# Altium schematic sheet USB_interface.SchDoc: =DT_SCH_Title
size A4; Organization: Droid Technologies; SheetNumber: 19; SheetTotal: 21
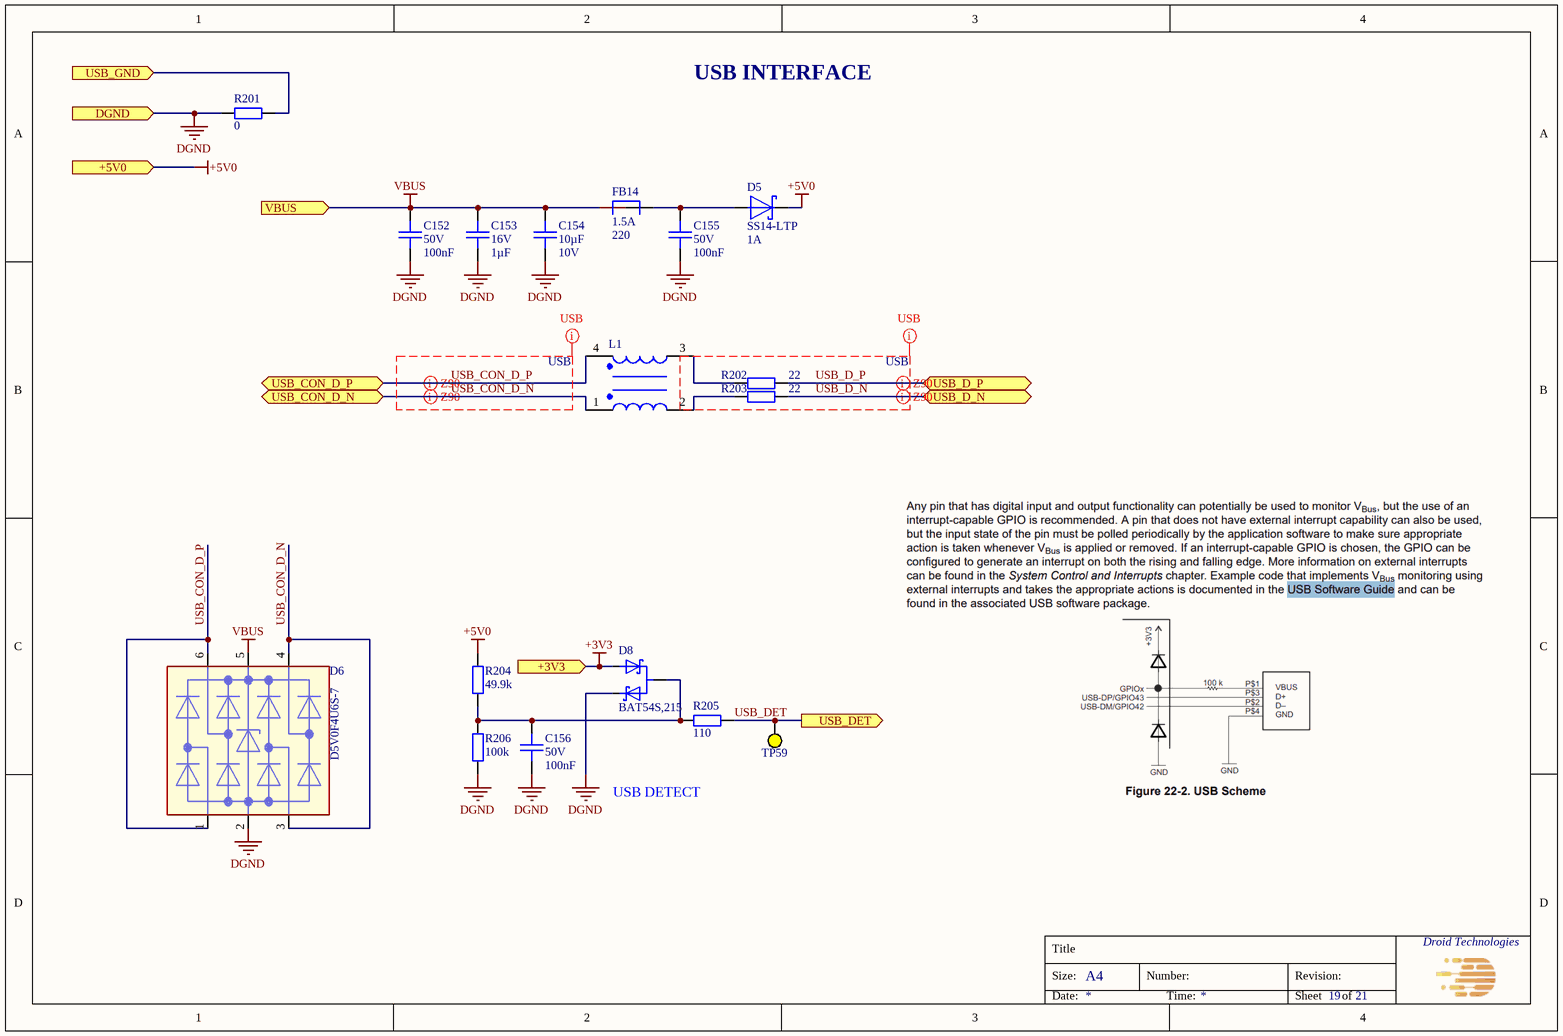
[diagram p0: USB_interface.SchDoc]

## Parts
C152  Voltage Rating: 50V  Capacitance: 100nF  [CAPC100x50x50L25]  (hidden comment: GCM155L8EH104KE07D)
C153  Voltage Rating: 16V  Capacitance: 1µF  [CAPC160X80X90L35]  (hidden comment: GCG188L8EE105KA07D)
C154  Capacitance: 10µF  Voltage Rating: 10V  [CAPC200X125X145L50]  (hidden comment: CGA4J1X8L1A106K125AC)
C155  Voltage Rating: 50V  Capacitance: 100nF  [CAPC100x50x50L25]  (hidden comment: GCM155L8EH104KE07D)
C156  Voltage Rating: 50V  Capacitance: 100nF  [CAPC100x50x50L25]  (hidden comment: GCM155L8EH104KE07D)
D5  Current - Average Rectified (Io): 1A  [DIOM520X260X290XL115X145]  (hidden comment: SS14-LTP)
D6  D5V0F4U6S-7  [SOP6P65_200X210X90L85X20]
D8  BAT54S,215  [SOT23-3P95_237X112L50X40]
FB14  Imax: 1.5A  Impedance: 220  [BEADC160X80X95L40]  (hidden comment: BLM18KG221BH1D)
L1  2 Line Common Mode Choke  [DLW21HN900SQ2L]  (value not drawn)
R201  Resistance: 0  [RESC160X80X55L30]  (hidden comment: RC0603FR-070RL)
R202  Resistance: 22  [RESC100X50X40L25]  (hidden comment: RC0402FR-0722RL)
R203  Resistance: 22  [RESC100X50X40L25]  (hidden comment: RC0402FR-0722RL)
R204  Resistance: 49.9k  [RESC100X50X40L25]  (hidden comment: RC0402FR-0749K9L)
R205  Resistance: 110  [RESC100X50X40L25]  (hidden comment: RC0402FR-07110RL)
R206  Resistance: 100k  [RESC100X50X40L25]  (hidden comment: RC0402FR-07100KL)
TP59  Test Point  [TP_D0.75mm]  (value not drawn)  (no BOM)

## Ports
+3V3 (in), +5V0 (in), DGND (in), USB_CON_D_N (bidir), USB_CON_D_P (bidir), USB_D_N (bidir), USB_D_P (bidir), USB_DET (out), USB_GND (in), VBUS (in)

## Nets
+3V3: D8.1 ; port +3V3
+5V0: D5.1 R204.2 ; port +5V0
DGND: C152.1 C153.1 C154.1 C155.1 C156.1 D6.2 D8.2 R201.2 R206.1 ; port DGND
VBUS: C152.2 C153.2 C154.2 D6.5 FB14.1 ; port VBUS
USB_CON_D_N: D6.3 D6.4 L1.1 ; port USB_CON_D_N
USB_CON_D_P: D6.1 D6.6 L1.4 ; port USB_CON_D_P
USB_D_N: R203.2 ; port USB_D_N
USB_D_P: R202.2 ; port USB_D_P
USB_DET: R205.2 TP59.1 ; port USB_DET
USB_GND: R201.1 ; port USB_GND
NetC155_2: C155.2 D5.2 FB14.2
NetC156_2: C156.2 D8.3 R204.1 R205.1 R206.2
NetL1_2: L1.2 R203.1
NetL1_3: L1.3 R202.1

## Layout directives
differential pair: USB_CON_D_N, USB_CON_D_P, USB_D_N, USB_D_P
net class USB: USB_CON_D_N, USB_CON_D_P, USB_D_N, USB_D_P

## Notes on the sheet
- USB INTERFACE
- USB DETECT
- Title
- Size:
- A4
- Number:
- Revision:
- Date:
- Time:
- Sheet
- of

## Library data of the parts
C152 C155 C156 = CMP-001-1980-2: CAP CER 0.1UF 50V X8L 0402; Manufacturer: Murata Electronics; Op Temp max: 150°C; Op Temp min: -55°C; Tolerance: 10%; Height max: 550µm; ComponentLink3Description: Digikey; Mounting Type: SM; ComponentLink3URL: https://www.digikey.com/en/products/detail/murata-electronics/GCM155L8EH104KE07D/11618823; Package: 0402 (1005 Metric); Lead Spacing: 0mm; MPN: GCM155L8EH104KE07D; Size: 1.00mm x 0.50mm; Ratings: AEC-Q200; ComponentLink1URL: https://www.murata.com/en-us/products/productdetail?partno=GCM155L8EH104KE07%23; ComponentLink1Description: Datasheet; Dielectric: X8L; ComponentLink2Description: Mouser; ComponentLink2URL: https://eu.mouser.com/ProductDetail/Murata-Electronics/GCM155L8EH104KE07D?qs=1mbolxNpo8fQSHf0HYnZWw%3D%3D
C153 = CMP-001-1982-2: CAP CER 1UF 16V X8L 0603; Manufacturer: Murata Electronics; Tolerance: 10%; Op Temp min: -55°C; Op Temp max: 150°C; ComponentLink3URL: https://www.digikey.com/en/products/detail/murata-electronics/GCG188L8EE105KA07D/10695125; Package: 0603 (1608 Metric); MPN: GCG188L8EE105KA07D; ComponentLink2URL: https://eu.mouser.com/ProductDetail/Murata-Electronics/GCG188L8EE105KA07D?qs=rrS6PyfT74dFMfTR80dVTA%3D%3D; Dielectric: X8L; Size: 1.60mm x 0.80mm; ComponentLink1Description: Datasheet; ComponentLink1URL: https://www.murata.com/en-us/products/productdetail?partno=GCG188L8EE105KA07%23; ComponentLink2Description: Mouser; Height max: 900µm; Mounting Type: SM; ComponentLink3Description: Digikey; Lead Spacing: 0mm; Ratings: AEC-Q200
C154 = CMP-001-1984-2: CAP CER 10UF 10V X8L 0805; Manufacturer: TDK Corporation; Tolerance: 10%; Op Temp min: -55°C; Op Temp max: 150°C; ComponentLink3Description: Digikey; Mounting Type: SM; Ratings: AEC-Q200; ComponentLink1Description: Datasheet; ComponentLink3URL: https://www.digikey.com/en/products/detail/tdk-corporation/CGA4J1X8L1A106K125AC/9991388; Lead Spacing: 0mm; MPN: CGA4J1X8L1A106K125AC; Size: 2.00mm x 1.25mm; Height max: 1.5mm; ComponentLink2URL: https://eu.mouser.com/ProductDetail/TDK/CGA4J1X8L1A106K125AC?qs=gZXFycFWdANzH%252B2UvJJjtQ%3D%3D; Package: 0805 (2012 Metric); ComponentLink2Description: Mouser; Dielectric: X8L; ComponentLink1URL: https://product.tdk.com/en/search/capacitor/ceramic/mlcc/info?part_no=CGA4J1X8L1A106K125AC
D5 = CMP-001-0248-5: DIODE SCHOTTKY 40V 1A DO214AC; Manufacturer: Micro Commercial Co; Capacitance: 52pF; Op Temp max: 125°C; Op Temp min: -55°C; Reverse Recovery Time (trr): 0s; Voltage - Forward (Vf) (Max) @ If: 500 mV @ 1 A; ComponentLink1URL: https://www.mccsemi.com/pdf/Products/SS12-L-SS110-L(DO-214AC).pdf; Height max: 2.44mm; ComponentLink1Description: Datasheet; Package: DO-214AC, SMA; ComponentLink2Description: Mouser; Size: 5.2x2.6; Diode Type: Schottky; ComponentLink3Description: Digikey; MPN: SS14-LTP; ComponentLink2URL: https://www2.mouser.com/ProductDetail/Micro-Commercial-Components-MCC/SS14-LTP?qs=%2Fha2pyFadujIpB0%252ByFcAqIT7YGlaGT7g1IJJK3bT00s%3D; ComponentLink3URL: https://www.digikey.com/en/products/detail/micro-commercial-co/SS14-LTP/7652330?s=N4IgTCBcDaIMpwIwBYC0AZAKgBRAXQF8g; Voltage - DC Reverse (Vr) (Max): 40V; Mounting Type: SM
D6 = CMP-001-1245-2: TVS DIODE 5.5VWM 12VC SOT363; Manufacturer: Diodes Incorporated; Cap @ Freq: 0.5pF @ 1MHz; Vc: 12V; Op Temp max: 150°C; Unidirectional Channels: 4; P: 200mW; Vbr: 6V; Vrwm: 5.5V; Op Temp min: -55°C; Height max: 1.1mm; ComponentLink3URL: https://www.digikey.com/en/products/detail/diodes-incorporated/D5V0F4U6S-7/7724995?s=N4IgTCBcDaICIFYBqAGAYgFgKoDYDKAtAOwgC6AvkA; Bidirectional Channels: -; Size: 2.15mm x 2.1mm; Mounting Type: SM; ComponentLink1Description: Datasheet; ComponentLink2Description: Mouser; Package: 6-TSSOP, SC-88, SOT-363; MPN: D5V0F4U6S-7; Ratings: -; ComponentLink1URL: https://www.diodes.com/assets/Datasheets/D5V0F4U6S.pdf; ComponentLink2URL: https://eu.mouser.com/ProductDetail/Diodes-Incorporated/D5V0F4U6S-7?qs=L1DZKBg7t5HMc2d93K7aHQ%3D%3D; ComponentLink3Description: Digikey
D8 = BAT54S,215: DIODE ARR SCHOTT 30V TO236AB; Manufacturer: Nexperia USA Inc.; Diode Configuration: 1 Pair Series Connection; Current - Average Rectified (Io) (per Diode): 200mA; Voltage - Forward (Vf) (Max) @ If: 800 mV @ 100 mA; Reverse Recovery Time (trr): 5 ns; Current - Reverse Leakage @ Vr: 2 µA @ 25 V; MPN: BAT54S,215; Technology: Schottky; Voltage - DC Reverse (Vr) (Max): 30 V; ComponentLink1Description: DigiKey; ComponentLink1URL: https://www.digikey.bg/en/products/detail/nexperia-usa-inc/BAT54S-215/763218; Operating Temperature - Junction: 150°C (Max); Package / Case: TO-236-3, SC-59, SOT-23-3; Mounting Type: SM; ComponentLink2Description: Datasheet; ComponentLink2URL: https://assets.nexperia.com/documents/data-sheet/BAT54S.pdf
FB14 = CMP-001-1981-1: FERRITE BEAD 220 OHM 0603 1LN; Manufacturer: Murata Electronics; DCR: 50m; Op Temp min: -55°C; Frequency: 100MHz; Op Temp max: 150°C; Number of Lines: 1; Mounting Type: SM; Size: 1.60mm x 0.80mm; ComponentLink2URL: https://eu.mouser.com/ProductDetail/Murata-Electronics/BLM18KG221BH1D?qs=sJ5gq5MLFXpgEHYBdWUtkQ%3D%3D; ComponentLink1Description: Datasheet; ComponentLink1URL: https://www.murata.com/en-us/products/productdata/8798137286686/QNFA9129.pdf; Lead Spacing: 0mm; Ratings: AEC-Q200; ComponentLink3Description: Digikey; ComponentLink3URL: https://www.digikey.com/en/products/detail/murata-electronics/BLM18KG221BH1D/6156000; Height max: 950µm; Package: 0603 (1608 Metric); ComponentLink2Description: Mouser; MPN: BLM18KG221BH1D
L1 = AWCU00201212900M02: CMC 330MA 2LN 90OHM SMD AEC-Q200; Manufacturer: Pulse Electronics; MPN: AWCU00201212900M02
R201 = CMP-001-0927-2: RES 0 OHM JUMPER 1/10W 0603; Manufacturer: YAGEO; Op Temp min: -55°C; Op Temp max: 155°C; Power: 100mW; Tolerance: 0%; Height max: 550µm; ComponentLink2URL: https://eu.mouser.com/ProductDetail/YAGEO/RC0603FR-070RL?qs=0yPvnVz5%2FmpDQv43TwvCfw%3D%3D; Temperature Coefficient: -; ComponentLink3Description: Digikey; ComponentLink2Description: Mouser; MPN: RC0603FR-070RL; ComponentLink1URL: https://www.yageo.com/upload/media/product/productsearch/datasheet/rchip/PYu-RC_Group_51_RoHS_L_12.pdf; Ratings: -; Size: 1.60mm x 0.80mm; Composition: Thick Film; Mounting Type: SM; ComponentLink3URL: https://www.digikey.com/en/products/detail/yageo/RC0603FR-070RL/1304008; Package: 0603 (1608 Metric); ComponentLink1Description: Datasheet
R202 R203 = CMP-001-0482-4: RES 22 OHM 1% 1/16W 0402; Manufacturer: YAGEO; Temperature Coefficient: ±100ppm; Op Temp max: 155°C; Op Temp min: -55°C; Power: 63mW; Ratings: -; ComponentLink3URL: https://www.digikey.com/en/products/detail/yageo/RC0402FR-0722RL/726562; ComponentLink2URL: https://eu.mouser.com/ProductDetail/YAGEO/RC0402FR-0722RL?qs=V1yeUXFNrkkRg6zf08ADKQ%3D%3D; MPN: RC0402FR-0722RL; ComponentLink1Description: Datasheet; ComponentLink3Description: Digikey; Tolerance: 1%; Size: 1.00mm x 0.50mm; ComponentLink1URL: https://www.yageo.com/upload/media/product/productsearch/datasheet/rchip/PYu-RC_Group_51_RoHS_L_12.pdf; Composition: Thick Film; ComponentLink2Description: Mouser; Mounting Type: SM; Package: 0402 (1005 Metric); Height max: 400µm
R204 = CMP-00547-4: RES 49.9K OHM 1% 1/16W 0402; Manufacturer: YAGEO; Temperature Coefficient: ±100ppm; Power: 63mW; Op Temp min: -55°C; Op Temp max: 155°C; ComponentLink1Description: Datasheet; Composition: Thick Film; Ratings: -; ComponentLink2URL: https://eu.mouser.com/ProductDetail/YAGEO/RC0402FR-0749K9L?qs=QT1cPpUoD8GsWnpgOWR2jA%3D%3D; ComponentLink3URL: https://www.digikey.com/en/products/detail/yageo/RC0402FR-0749K9L/726620; ComponentLink2Description: Mouser; MPN: RC0402FR-0749K9L; Package: 0402 (1005 Metric); Mounting Type: SM; ComponentLink1URL: https://www.yageo.com/upload/media/product/productsearch/datasheet/rchip/PYu-RC_Group_51_RoHS_L_12.pdf; Size: 1.00mm x 0.50mm; Tolerance: 1%; ComponentLink3Description: Digikey; Height max: 400µm
R205 = CMP-001-0497-6: RES 110 OHM 1% 1/16W 0402; Manufacturer: YAGEO; Power: 63mW; Op Temp min: -55°C; Op Temp max: 155°C; Temperature Coefficient: ±100ppm; Size: 1.00mm x 0.50mm; ComponentLink1Description: Datasheet; Package: 0402 (1005 Metric); ComponentLink2URL: https://eu.mouser.com/ProductDetail/YAGEO/RC0402FR-07110RL?qs=QWYorlrD8IXj7iGvwWbRbA%3D%3D; MPN: RC0402FR-07110RL; ComponentLink3Description: Digikey; Height max: 400µm; Ratings: -; ComponentLink3URL: https://www.digikey.com/en/products/detail/yageo/RC0402FR-07110RL/2827583; Composition: Thick Film; ComponentLink2Description: Mouser; Tolerance: 1%; Mounting Type: SM; ComponentLink1URL: https://www.yageo.com/upload/media/product/productsearch/datasheet/rchip/PYu-RC_Group_51_RoHS_L_12.pdf
R206 = CMP-00121-6: RES 100K OHM 1% 1/16W 0402; Manufacturer: YAGEO; Op Temp min: -55°C; Op Temp max: 155°C; Power: 63mW; Temperature Coefficient: ±100ppm; ComponentLink2Description: Mouser; Mounting Type: SM; Composition: Thick Film; ComponentLink3URL: https://www.digikey.com/en/products/detail/yageo/RC0402FR-07100KL/726526; Size: 1.00mm x 0.50mm; MPN: RC0402FR-07100KL; Tolerance: 1%; Ratings: -; ComponentLink1Description: Datasheet; ComponentLink2URL: https://eu.mouser.com/ProductDetail/YAGEO/RC0402FR-07100KL?qs=%2Fha2pyFaduhjtLcYvKXQ8IUndG0u%252BuCx1gxMxvN%252Btd7iB7mgHWsSbw%3D%3D; Package: 0402 (1005 Metric); ComponentLink1URL: https://www.yageo.com/upload/media/product/productsearch/datasheet/rchip/PYu-RC_Group_51_RoHS_L_12.pdf; ComponentLink3Description: Digikey; Height max: 400µm
TP59 = TP_0.75: Test point 0.75mm